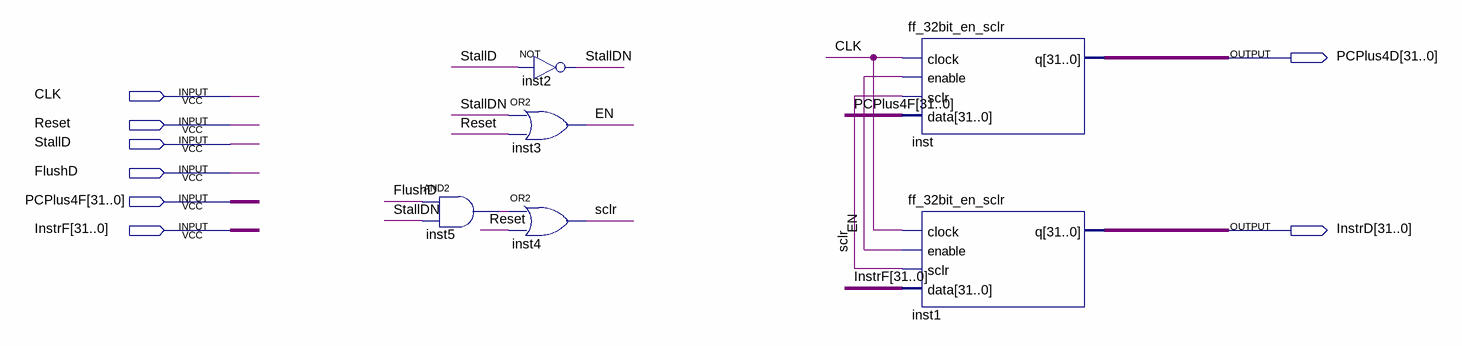
[diagram p0: schematic sheet]
// Quartus schematic IF_ID_Reg.bdf as structural Verilog: 6 symbols, 8 pins
module IF_ID_Reg (
  input  CLK,
  input  Reset,
  input  StallD,
  input  FlushD,
  input  [31:0] PCPlus4F,
  input  [31:0] InstrF,
  output [31:0] PCPlus4D,
  output [31:0] InstrD
);

  wire EN, inst5_out, sclr, StallDN;

  and inst5 (inst5_out, FlushD, StallDN);
  not inst2 (StallDN, StallD);
  or inst3 (EN, StallDN, Reset);
  or inst4 (sclr, inst5_out, Reset);
  ff_32bit_en_sclr inst (.clock(CLK), .enable(EN), .sclr(sclr), .data(PCPlus4F), .q(PCPlus4D));
  ff_32bit_en_sclr inst1 (.clock(CLK), .enable(EN), .sclr(sclr), .data(InstrF), .q(InstrD));
endmodule
